# Altium schematic sheet PID_Controller.SchDoc
size A; SheetNumber: 6; SheetTotal: 7
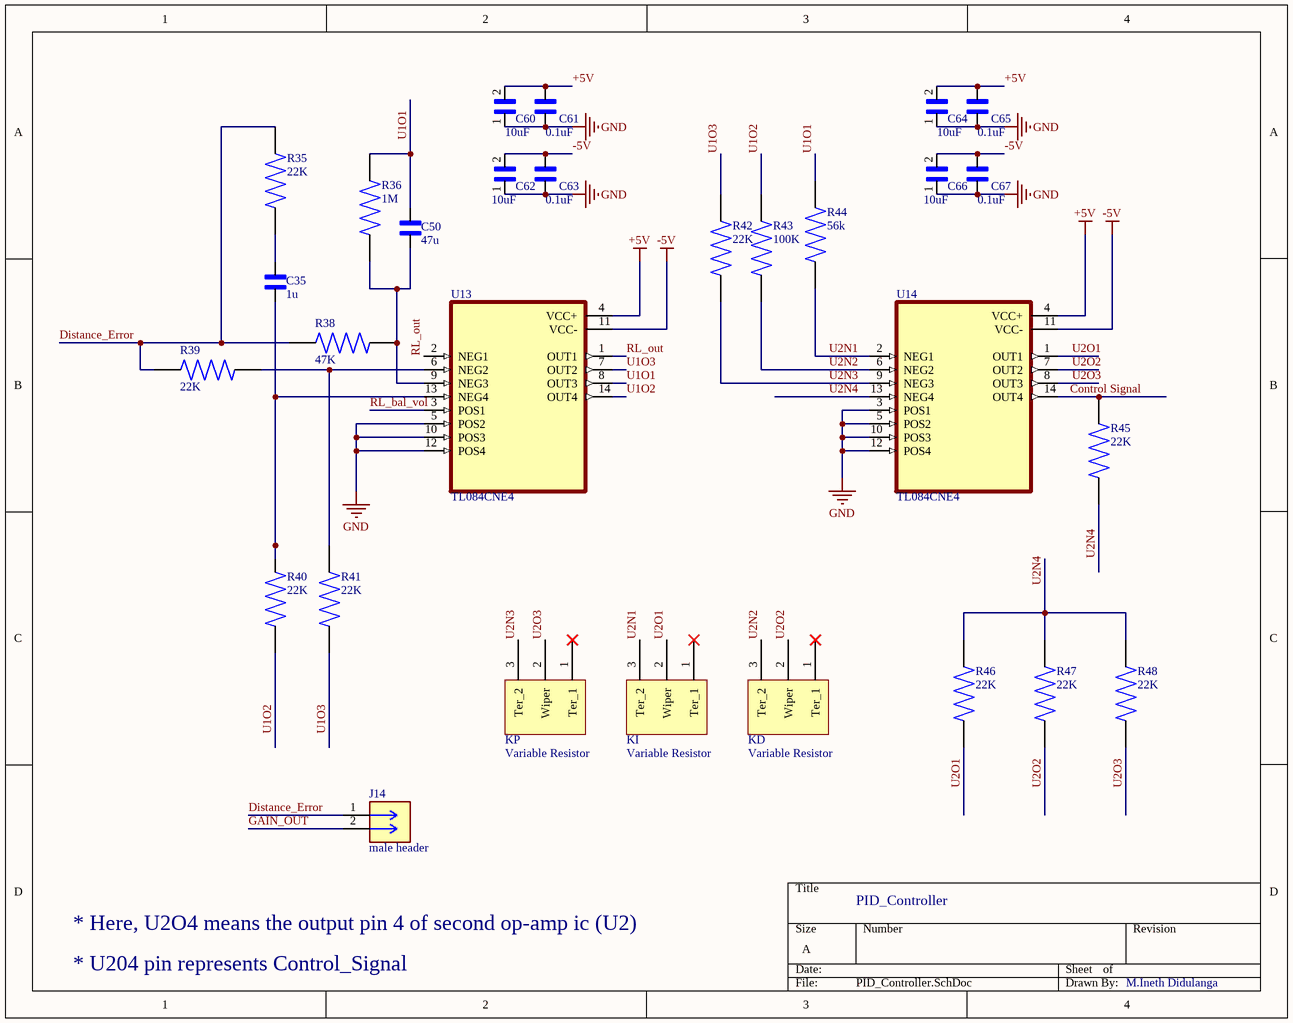
[diagram p0: PID_Controller.SchDoc]

## Parts
C35  1u  [CAPC2012X140N]
C50  47u  [CAPC2012X140N]
C60  10uF  [CAPC2012X145N]
C61  0.1uF  [CAPC2012X140N]
C62  10uF  [CAPC2012X145N]
C63  0.1uF  [CAPC2012X140N]
C64  10uF  [CAPC2012X145N]
C65  0.1uF  [CAPC2012X140N]
C66  10uF  [CAPC2012X145N]
C67  0.1uF  [CAPC2012X140N]
J14  male header  [CONN02_901200922_MOL]
KD  Variable Resistor  [PCBComponent_1]
KI  Variable Resistor  [PCBComponent_1]
KP  Variable Resistor  [PCBComponent_1]
R35  22K  [RESC2012X65N]
R36  1M  [RESC2012X55N]
R38  47K  [RESC2012X65N]
R39  22K  [RESC2012X65N]
R40  22K  [RESC2012X65N]
R41  22K  [RESC2012X65N]
R42  22K  [RESC2012X65N]
R43  100K  [RESC2012X55N]
R44  56k  [RESC2012X55N]
R45  22K  [RESC2012X65N]
R46  22K  [RESC2012X65N]
R47  22K  [RESC2012X65N]
R48  22K  [RESC2012X65N]
U13  TL084CNE4  [SOIC127P780X200-14N]
U14  TL084CNE4  [SOIC127P780X200-14N]

## Nets
+5V: C60.2 C61.1 C64.2 C65.1 U13.4(VCC+) U14.4(VCC+)
-5V: C62.2 C63.1 C66.2 C67.1 U13.11(VCC-) U14.11(VCC-)
GND: C60.1 C61.2 C62.1 C63.2 C64.1 C65.2 C66.1 C67.2 U13.5(POS2) U13.10(POS3) U13.12(POS4) U14.3(POS1) U14.5(POS2) U14.10(POS3) U14.12(POS4)
Control Signal: R45.2 U14.14(OUT4)
Distance_Error: J14.1 R35.2 R38.1 R39.1
GAIN_OUT: J14.2
RL_bal_vol: U13.3(POS1)
RL_out: U13.1(OUT1) U13.2(NEG1)
U1O1: C50.1 R36.2 R44.2 U13.8(OUT3)
U1O2: R40.1 R43.2 U13.14(OUT4)
U1O3: R41.1 R42.2 U13.7(OUT2)
U2N1: KI.3(Ter_2) R44.1 U14.2(NEG1)
U2N2: KD.3(Ter_2) R43.1 U14.6(NEG2)
U2N3: KP.3(Ter_2) R42.1 U14.9(NEG3)
U2N4: R45.1 R46.2 R47.2 R48.2 U14.13(NEG4)
U2O1: KI.2(Wiper) R46.1 U14.1(OUT1)
U2O2: KD.2(Wiper) R47.1 U14.7(OUT2)
U2O3: KP.2(Wiper) R48.1 U14.8(OUT3)
NetC35_1: C35.1 R35.1
NetC35_2: C35.2 R40.2 U13.13(NEG4)
NetC50_2: C50.2 R36.1 R38.2 U13.9(NEG3)
NetR39_2: R39.2 R41.2 U13.6(NEG2)

Not connected (* = marked no-connect by the designer): KD 1(Ter_1)*; KI 1(Ter_1)*; KP 1(Ter_1)*

## Notes on the sheet
- PID_Controller
- * Here, U2O4 means the output pin 4 of second op-amp ic (U2)
- * U204 pin represents Control_Signal
- M.Ineth Didulanga

## Library data of the parts
C35 C50 C61 C63 C65 C67 = FS055C104K4Z2A: 0.1 ÂµF Â±10% 50V Ceramic Capacitor X7R 0805 (2012 Metric); MF: AVX; SnapEDA_Link: https://www.snapeda.com/parts/FS055C104K4Z2A/AVX/view-part/?ref=snap; Package: 0805-2 AVX; Value: *; MP: FS055C104K4Z2A; Check_prices: https://www.snapeda.com/parts/FS055C104K4Z2A/AVX/view-part/?ref=eda
C60 C62 C64 C66 = C2012X6S1C106K125AC: C Series 0805 10 uF 16 V Â±10 % Tolerance X6S SMT Multilayer Ceramic Capacitor; MF: TDK; MP: C2012X6S1C106K125AC; SnapEDA_Link: https://www.snapeda.com/parts/C2012X6S1C106K125AC/TDK-Lambda+Americas+Inc/view-part/?ref=snap; Check_prices: https://www.snapeda.com/parts/C2012X6S1C106K125AC/TDK-Lambda+Americas+Inc/view-part/?ref=eda; Value: *; Purchase-URL: https://pricing.snapeda.com/search/part/C2012X6S1C106K125AC/?ref=eda; Package: 2012 TDK
J14 = 901200922: Package: None; Price: None; Value: *; MP: 901200922; Availability: Unavailable
R35 R39-R42 R45-R48 = CRGCQ0805F22K: Fixed Resistor CRGCQ 0805 22K 1%; MF: TE Connectivity; SnapEDA_Link: https://www.snapeda.com/parts/CRGCQ0805F22K/TE+Connectivity/view-part/?ref=snap; Package: 2012 TE Connectivity; Value: *; MP: CRGCQ0805F22K; Check_prices: https://www.snapeda.com/parts/CRGCQ0805F22K/TE+Connectivity/view-part/?ref=eda
R36 R43 R44 = MCU08050C1002FPW00: Res Thin Film 0805 10K Ohm 1% 0.125W(1/8W) Â±50ppm/Â°C Sulfur Resistant Pad SMD Automotive Medical T/R; MF: Vishay; SnapEDA_Link: https://www.snapeda.com/parts/MCU08050C1002FPW00/Vishay/view-part/?ref=snap; Package: 2012 Vishay; Value: *; MP: MCU08050C1002FPW00; Check_prices: https://www.snapeda.com/parts/MCU08050C1002FPW00/Vishay/view-part/?ref=eda
R38 = CRGCQ0805F47K: Fixed Resistor CRGCQ 0805 47K 1%; MF: TE Connectivity; SnapEDA_Link: https://www.snapeda.com/parts/CRGCQ0805F47K/TE+Connectivity/view-part/?ref=snap; Package: 2012 TE Connectivity; Value: *; MP: CRGCQ0805F47K; Check_prices: https://www.snapeda.com/parts/CRGCQ0805F47K/TE+Connectivity/view-part/?ref=eda
U13 U14 = TL084CNE4: Quad High Slew Rate JFET-Input Operational Amplifier 14-PDIP 0 to 70; MF: Texas Instruments; SnapEDA_Link: https://www.snapeda.com/parts/TL084CNE4/Texas+Instruments/view-part/?ref=snap; Package: PDIP-14 Texas Instruments; Value: *; MP: TL084CNE4; Check_prices: https://www.snapeda.com/parts/TL084CNE4/Texas+Instruments/view-part/?ref=eda